# Altium schematic sheet ANALOG_MEASUREMENT_CIRCUIT.SchDoc
size A3; SheetNumber: 3; SheetTotal: 9
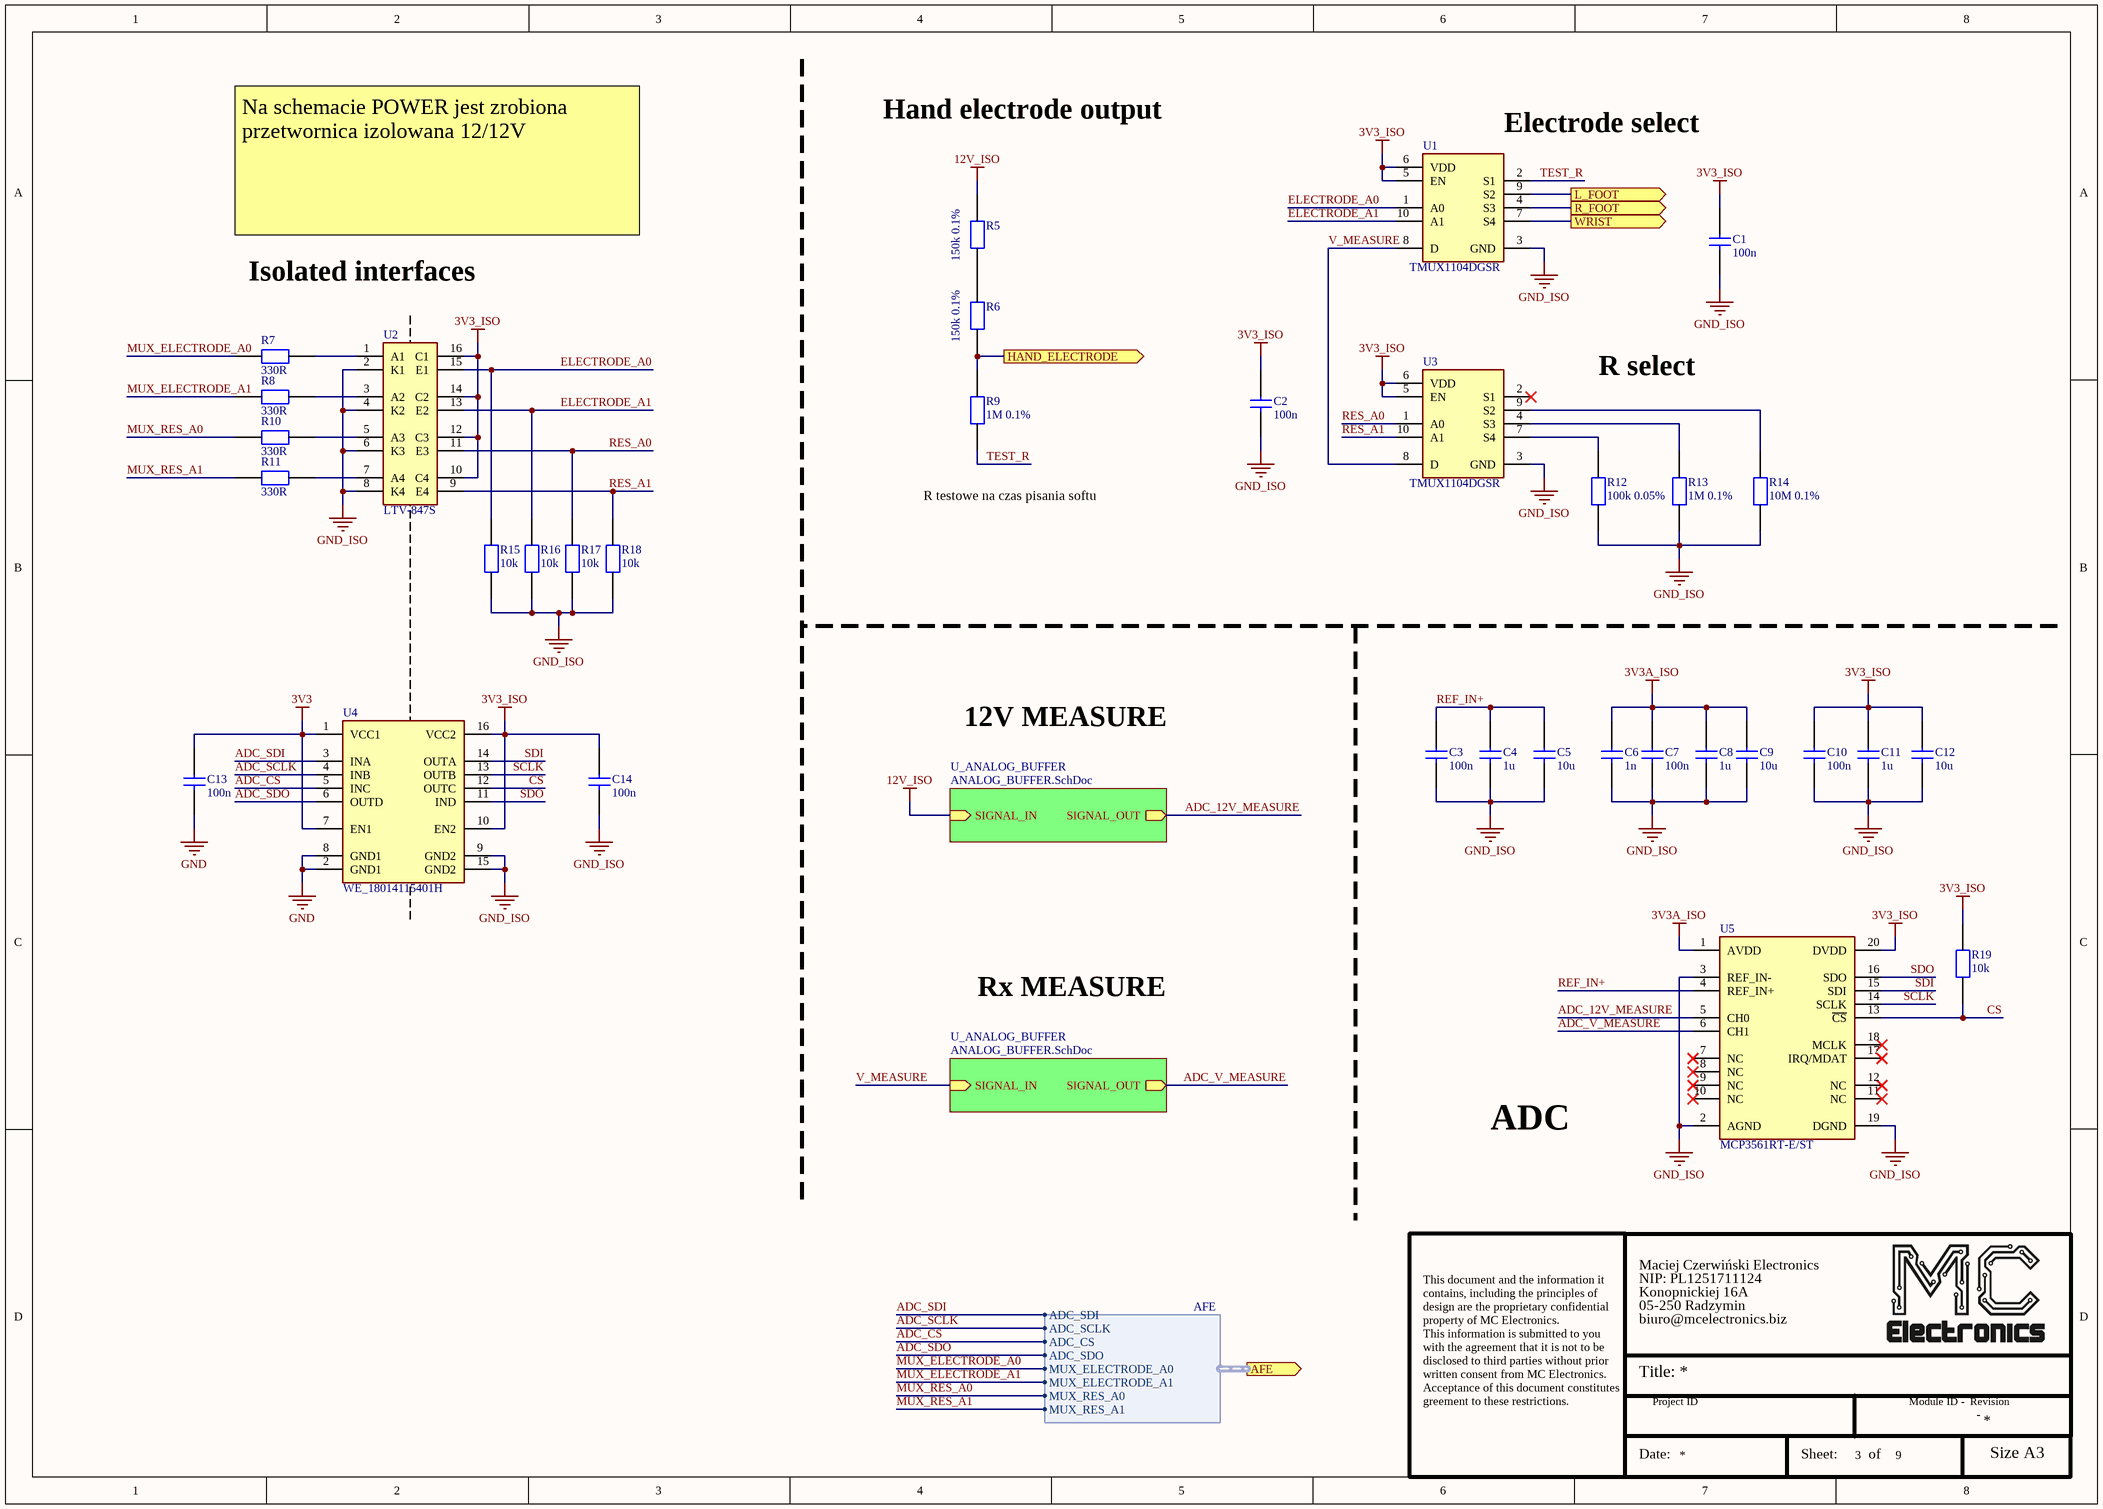
[diagram p0: ANALOG_MEASUREMENT_CIRCUIT.SchDoc]

## Parts
C1  value 100n  [0603C]  (hidden comment: 100nF 50V X7R 10%)
C2  value 100n  [0603C]  (hidden comment: 100nF 50V X7R 10%)
C3  value 100n  [0603C]  (hidden comment: 100nF 50V X7R 10%)
C4  value 1u  [0603C]  (hidden comment: 1uF 16V X5R 10%)
C5  value 10u  [0603C]  (hidden comment: 10uF 25V X5R 10%)
C6  value 1n  [0603C]  (hidden comment: 1nF 50V X7R 10%)
C7  value 100n  [0603C]  (hidden comment: 100nF 50V X7R 10%)
C8  value 1u  [0603C]  (hidden comment: 1uF 16V X5R 10%)
C9  value 10u  [0603C]  (hidden comment: 10uF 25V X5R 10%)
C10  value 100n  [0603C]  (hidden comment: 100nF 50V X7R 10%)
C11  value 1u  [0603C]  (hidden comment: 1uF 16V X5R 10%)
C12  value 10u  [0603C]  (hidden comment: 10uF 25V X5R 10%)
C13  value 100n  [0603C]  (hidden comment: 100nF 50V X7R 10%)
C14  value 100n  [0603C]  (hidden comment: 100nF 50V X7R 10%)
R5  value 150k 0.1%  [0603R]  (hidden comment: 150k 0.1% 0.1W)
R6  value 150k 0.1%  [0603R]  (hidden comment: 150k 0.1% 0.1W)
R7  value 330R  [0603R]  (hidden comment: 330R 1% 0.1W)
R8  value 330R  [0603R]  (hidden comment: 330R 1% 0.1W)
R9  value 1M 0.1%  [0603R]  (hidden comment: 1M 0.1% 0.1W)
R10  value 330R  [0603R]  (hidden comment: 330R 1% 0.1W)
R11  value 330R  [0603R]  (hidden comment: 330R 1% 0.1W)
R12  value 100k 0.05%  [0603R]  (hidden comment: 100k 0.05% 0.167W)
R13  value 1M 0.1%  [0603R]  (hidden comment: 1M 0.1% 0.1W)
R14  value 10M 0.1%  [1206R]  (hidden comment: 10M 0.1% 0.5W)
R15  value 10k  [0603R]  (hidden comment: 10k 1% 0.1W)
R16  value 10k  [0603R]  (hidden comment: 10k 1% 0.1W)
R17  value 10k  [0603R]  (hidden comment: 10k 1% 0.1W)
R18  value 10k  [0603R]  (hidden comment: 10k 1% 0.1W)
R19  value 10k  [0603R]  (hidden comment: 10k 1% 0.1W)
U1  TMUX1104DGSR  [SOP50P490X110-10N]
U2  LTV-847S  [SOP254P600-16N]
U3  TMUX1104DGSR  [SOP50P490X110-10N]
U4  WE_18014115401H  [WPME-CDIS_SOIC-16WB_18014x15401x]
U5  MCP3561RT-E/ST  [TSOP65P640X120-20N]

## Sub-sheets
U_ANALOG_BUFFER = ANALOG_BUFFER.SchDoc: SIGNAL_IN (in), SIGNAL_OUT (out)
U_ANALOG_BUFFER = ANALOG_BUFFER.SchDoc: SIGNAL_IN (in), SIGNAL_OUT (out)

## Ports
AFE (out, harness AFE), HAND_ELECTRODE (out), L_FOOT (out), R_FOOT (out), WRIST (out)

## Harnesses
AFE: ADC_SDI, ADC_SCLK, ADC_CS, ADC_SDO, MUX_ELECTRODE_A1, MUX_RES_A0, MUX_RES_A1, MUX_ELECTRODE_A0

## Nets
3V3: C13.2 U4.1(VCC1) U4.7(EN1)
3V3_ISO: C1.2 C2.2 C10.2 C11.2 C12.2 C14.2 R19.1 U1.5(EN) U1.6(VDD) U2.10(C4) U2.12(C3) U2.14(C2) U2.16(C1) U3.5(EN) U3.6(VDD) U4.10(EN2) U4.16(VCC2) U5.20(DVDD)
3V3A_ISO: C6.2 C7.2 C8.2 C9.2 U5.1(AVDD)
12V_ISO: R5.1 ; sheet U_ANALOG_BUFFER/SIGNAL_IN
GND: C13.1 U4.2(GND1) U4.8(GND1)
GND_ISO: C1.1 C2.1 C3.1 C4.1 C5.1 C6.1 C7.1 C8.1 C9.1 C10.1 C11.1 C12.1 C14.1 R12.2 R13.2 R14.2 R15.2 R16.2 R17.2 R18.2 U1.3(GND) U2.2(K1) U2.4(K2) U2.6(K3) U2.8(K4) U3.3(GND) U4.9(GND2) U4.15(GND2) U5.2(AGND) U5.3(REF_IN-) U5.19(DGND)
ADC_12V_MEASURE: U5.5(CH0) ; sheet U_ANALOG_BUFFER/SIGNAL_OUT
ADC_CS: U4.5(INC) ; port AFE.ADC_CS
ADC_SCLK: U4.4(INB) ; port AFE.ADC_SCLK
ADC_SDI: U4.3(INA) ; port AFE.ADC_SDI
ADC_SDO: U4.6(OUTD) ; port AFE.ADC_SDO
ADC_V_MEASURE: U5.6(CH1) ; sheet U_ANALOG_BUFFER/SIGNAL_OUT
CS: R19.2 U4.12(OUTC) U5.13(~{CS})
ELECTRODE_A0: R15.1 U1.1(A0) U2.15(E1)
ELECTRODE_A1: R16.1 U1.10(A1) U2.13(E2)
HAND_ELECTRODE: R6.2 R9.1 ; port HAND_ELECTRODE
L_FOOT: U1.9(S2) ; port L_FOOT
MUX_ELECTRODE_A0: R7.2 ; port AFE.MUX_ELECTRODE_A0
MUX_ELECTRODE_A1: R8.2 ; port AFE.MUX_ELECTRODE_A1
MUX_RES_A0: R10.2 ; port AFE.MUX_RES_A0
MUX_RES_A1: R11.2 ; port AFE.MUX_RES_A1
R_FOOT: U1.4(S3) ; port R_FOOT
REF_IN+: C3.2 C4.2 C5.2 U5.4(REF_IN+)
RES_A0: R17.1 U2.11(E3) U3.1(A0)
RES_A1: R18.1 U2.9(E4) U3.10(A1)
SCLK: U4.13(OUTB) U5.14(SCLK)
SDI: U4.14(OUTA) U5.15(SDI)
SDO: U4.11(IND) U5.16(SDO)
TEST_R: R9.2 U1.2(S1)
V_MEASURE: U1.8(D) U3.8(D) ; sheet U_ANALOG_BUFFER/SIGNAL_IN
WRIST: U1.7(S4) ; port WRIST
NetR5_2: R5.2 R6.1
NetR7_1: R7.1 U2.1(A1)
NetR8_1: R8.1 U2.3(A2)
NetR10_1: R10.1 U2.5(A3)
NetR11_1: R11.1 U2.7(A4)
NetR12_1: R12.1 U3.7(S4)
NetR13_1: R13.1 U3.4(S3)
NetR14_1: R14.1 U3.9(S2)

Not connected (* = marked no-connect by the designer): U3 2(S1)*; U5 7(NC)* 8(NC)* 9(NC)* 10(NC)* 11(NC)* 12(NC)* 17(IRQ/MDAT)* 18(MCLK)*

## Notes on the sheet
- Hand electrode output
- (near U1) Electrode select
- Na schemacie POWER jest zrobiona przetwornica izolowana 12/12V
- Isolated interfaces
- R select
- R testowe na czas pisania softu
- 12V MEASURE
- Rx MEASURE
- ADC
- This document and the information it
- contains, including the principles of
- design are the proprietary confidential
- property of MC Electronics.
- Maciej Czerwiński Electronics
- NIP: PL1251711124
- Konopnickiej 16A
- 05-250 Radzymin
- biuro@mcelectronics.biz
- This information is submitted to you
- with the agreement that it is not to be
- disclosed to third parties without prior
- written consent from MC Electronics.
- Acceptance of this document constitutes
- Title:
- greement to these restrictions.
- Date:
- Project ID
- Sheet:
- of
- Module ID -
- Revision
- -
- Size A3

## Library data of the parts
C1-C3 C7 C10 C13 C14 = GEN_100nF_50V_X7R_10%_0603: Generic capacitor 100n 0603; MC_ID: C00001; Generic: Yes; Mount type: SMT
C4 C8 C11 = GEN_1uF_16V_X5R_10%_0603: Generic capacitor 1u 0603; Generic: Yes; MC_ID: C00017; Mount type: SMT
C5 C9 C12 = GEN_10uF_25V_X5R_10%_0603: Generic capacitor 10u 0603; Generic: Yes; MC_ID: C00094; Mount type: SMT
C6 = GEN_1nF_50V_X7R_10%_0603: Generic capacitor 1nF 50V 0603; MC_ID: C00024; Generic: Yes; Mount type: SMT
R5 R6 = SPEC_150k_0.1%_0.1W_0603: Rezystor: thin film; 150kΩ; SMD; 0603; 100mW; ±0,1%; ERA3AEB 25ppm/C; Generic: Yes; MC_ID: xx; Specific PN: ERA3AEB154V; Mount type: SMT
R7 R8 R10 R11 = GEN_330R_1%_0.1W_0603: Generic resistor 330R 0603; Generic: Yes; MC_ID: R00067; Mount type: SMT
R9 R13 = SPEC_1M_0.1%_0.1W_0603: Rezystor: thin film; 1MΩ; precyzyjny; SMD; 0603; 0,1W; ±0,1%; AR; 75V 25ppm; Generic: Yes; MC_ID: xx; Specific PN: AR03BTCX1004; Mount type: SMT
R12 = SPEC_100k_0.05%_167mW_0603: Rezystor: thin film; 100kΩ; 0603; 167mW; ±0,05%; ARM-A; 10ppm/°C; Generic: Yes; MC_ID: xx; Specific PN: ARM03ATBM1003A; Mount type: SMT
R14 = SPEC_10M_0.1%_0.5W_1206: Rezystor: thin film; 10MΩ; precyzyjny; SMD; 1206; 0,5W; ±0,1%; 100V 25ppm; Generic: Yes; MC_ID: xx; Specific PN: MCA1206MD1005BP100; Mount type: SMT
R15-R19 = GEN_10k_1%_0.1W_0603: Generic resistor 10k 0603; MC_ID: R00003; Generic: Yes; Mount type: SMT
U1 U3 = TMUX1104DGSR: TMUX1104DGSR Analog multiplexer 4:1; MC_ID: xx; Generic: No; Specific PN: TMUX1104DGSR; Mount type: SMT
U2 = LTV-847S: Transoptor; SMD; Ch: 4; OUT: tranzystorowe; Uizol: 5kV; Uce: 35V; Generic: No; MC_ID: xx; Mount type: SMT; Specific PN: LTV-847S
U4 = WE_18014115401H: 4 (3/1)channel digital isolator, 150Mbps; Generic: No; MC_ID: x; Specific PN: WE_18014115401H; Mount type: SMT
U5 = MCP3561RT-E/ST: Analog to Digital Converters - ADC 24-bit delta-sigma ADC w/Vref, Single channel, 3V, 2CH; MC_ID: xx; Generic: No; Specific PN: MCP3561RT-E/ST; Mount type: SMT